# Altium schematic sheet BufferIC_Section.SchDoc
size A4
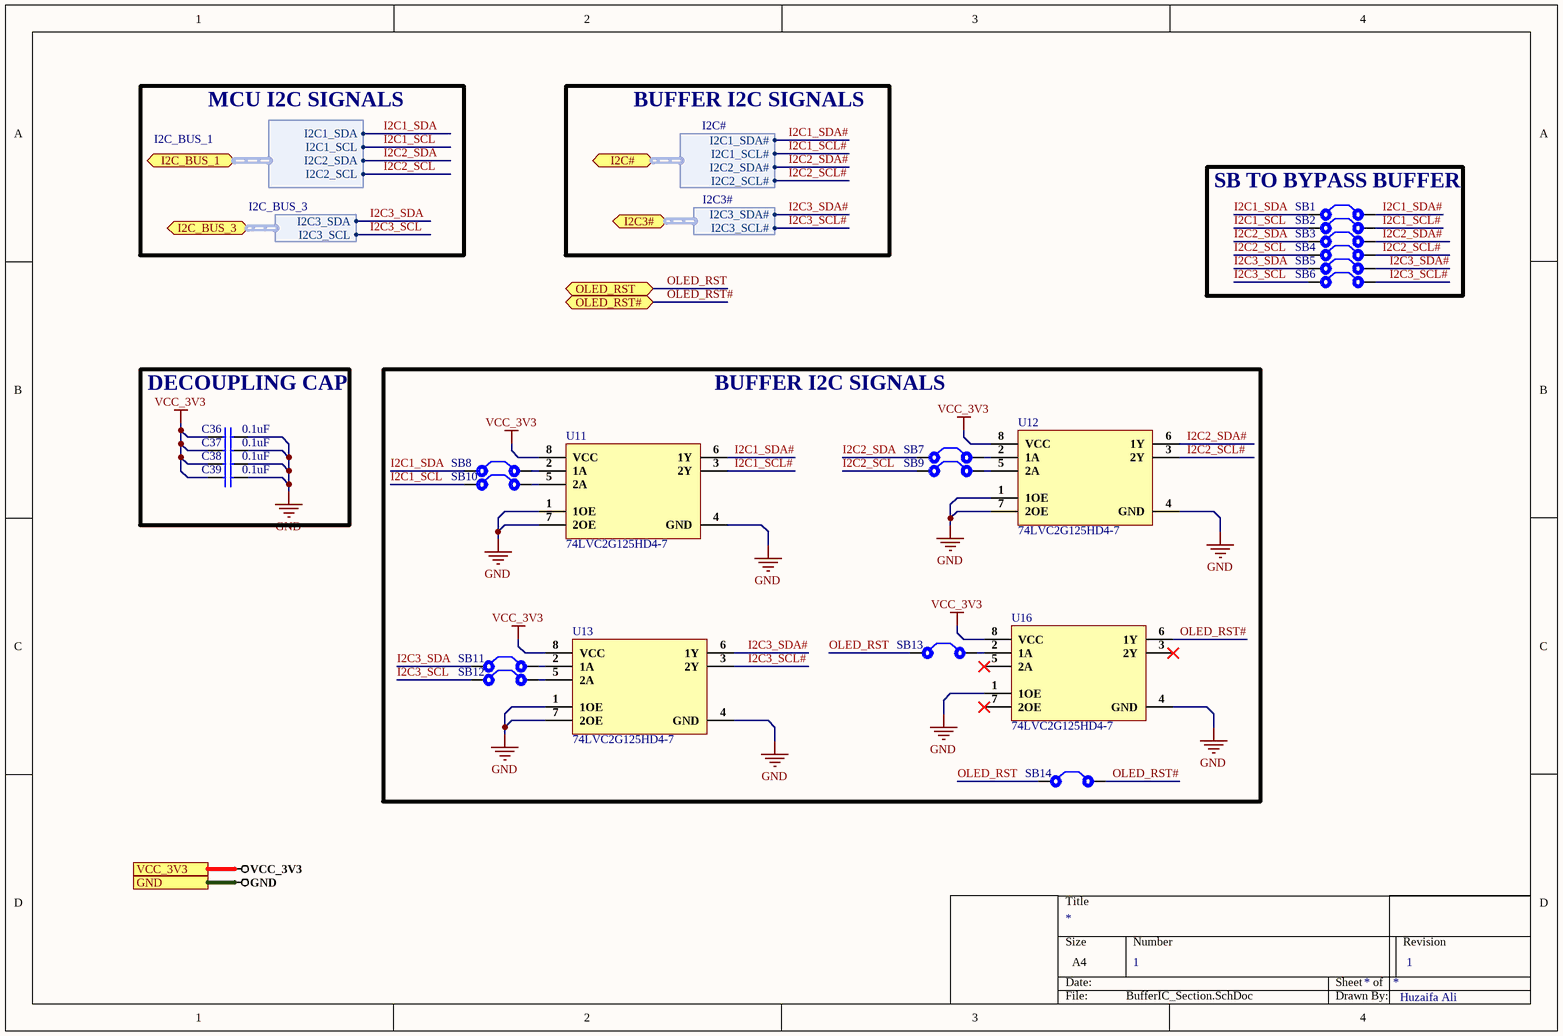
[diagram p0: BufferIC_Section.SchDoc]

## Parts
C36  0.1uF  [Cap0603]
C37  0.1uF  [Cap0603]
C38  0.1uF  [Cap0603]
C39  0.1uF  [Cap0603]
SB1  Solder Bridge  [Solder Bridge]  (value not drawn)
SB2  Solder Bridge  [Solder Bridge]  (value not drawn)
SB3  Solder Bridge  [Solder Bridge]  (value not drawn)
SB4  Solder Bridge  [Solder Bridge]  (value not drawn)
SB5  Solder Bridge  [Solder Bridge]  (value not drawn)
SB6  Solder Bridge  [Solder Bridge]  (value not drawn)
SB7  Solder Bridge  [Solder Bridge]  (value not drawn)
SB8  Solder Bridge  [Solder Bridge]  (value not drawn)
SB9  Solder Bridge  [Solder Bridge]  (value not drawn)
SB10  Solder Bridge  [Solder Bridge]  (value not drawn)
SB11  Solder Bridge  [Solder Bridge]  (value not drawn)
SB12  Solder Bridge  [Solder Bridge]  (value not drawn)
SB13  Solder Bridge  [Solder Bridge]  (value not drawn)
SB14  Solder Bridge  [Solder Bridge]  (value not drawn)
U11  74LVC2G125HD4-7  [74LVC2G125HD4-7]
U12  74LVC2G125HD4-7  [74LVC2G125HD4-7]
U13  74LVC2G125HD4-7  [74LVC2G125HD4-7]
U16  74LVC2G125HD4-7  [74LVC2G125HD4-7]

## Blocks framed on the sheet
SB TO BYPASS BUFFER: SB1-SB6
DECOUPLING CAP: C36-C39
BUFFER I2C SIGNALS: SB7-SB14 U11-U13 U16

## Ports
GND, I2C3# (bidir, harness I2C3#), I2C# (bidir, harness I2C#), I2C_BUS_1 (bidir, harness I2C_BUS_1), I2C_BUS_3 (bidir, harness I2C_BUS_3), OLED_RST (bidir), OLED_RST# (bidir), VCC_3V3

## Harnesses
I2C_BUS_1: I2C2_SDA, I2C1_SCL, I2C1_SDA, I2C2_SCL
I2C_BUS_3: I2C3_SDA, I2C3_SCL
I2C#: I2C1_SDA#, I2C1_SCL#, I2C2_SDA#, I2C2_SCL#
I2C3#: I2C3_SDA#, I2C3_SCL#

## Nets
GND: C36.2 C37.2 C38.2 C39.2 U11.1(1OE) U11.4(GND) U11.7(2OE) U12.1(1OE) U12.4(GND) U12.7(2OE) U13.1(1OE) U13.4(GND) U13.7(2OE) U16.1(1OE) U16.4(GND) ; port GND
VCC_3V3: C36.1 C37.1 C38.1 C39.1 U11.8(VCC) U12.8(VCC) U13.8(VCC) U16.8(VCC) ; port VCC_3V3
I2C1_SCL: SB2.1 SB10.1 ; port I2C_BUS_1.I2C1_SCL
I2C1_SCL#: SB2.2 U11.3(2Y) ; port I2C#.I2C1_SCL#
I2C1_SDA: SB1.1 SB8.1 ; port I2C_BUS_1.I2C1_SDA
I2C1_SDA#: SB1.2 U11.6(1Y) ; port I2C#.I2C1_SDA#
I2C2_SCL: SB4.1 SB9.1 ; port I2C_BUS_1.I2C2_SCL
I2C2_SCL#: SB4.2 U12.3(2Y) ; port I2C#.I2C2_SCL#
I2C2_SDA: SB3.1 SB7.1 ; port I2C_BUS_1.I2C2_SDA
I2C2_SDA#: SB3.2 U12.6(1Y) ; port I2C#.I2C2_SDA#
I2C3_SCL: SB6.1 SB12.1 ; port I2C_BUS_3.I2C3_SCL
I2C3_SCL#: SB6.2 U13.3(2Y) ; port I2C3#.I2C3_SCL#
I2C3_SDA: SB5.1 SB11.1 ; port I2C_BUS_3.I2C3_SDA
I2C3_SDA#: SB5.2 U13.6(1Y) ; port I2C3#.I2C3_SDA#
OLED_RST: SB13.1 SB14.1 ; port OLED_RST
OLED_RST#: SB14.2 U16.6(1Y) ; port OLED_RST#
NetSB7_2: SB7.2 U12.2(1A)
NetSB8_2: SB8.2 U11.2(1A)
NetSB9_2: SB9.2 U12.5(2A)
NetSB10_2: SB10.2 U11.5(2A)
NetSB11_2: SB11.2 U13.2(1A)
NetSB12_2: SB12.2 U13.5(2A)
NetSB13_2: SB13.2 U16.2(1A)

Not connected (* = marked no-connect by the designer): U16 3(2Y)* 5(2A)* 7(2OE)*

## Notes on the sheet
- MCU I2C SIGNALS
- BUFFER I2C SIGNALS
- 1
- Huzaifa Ali

## Library data of the parts
C36-C39 = CC0603ZRY5V9BB104: CAP CER 0.1UF 50V Y5V 0603; Manufacturer: Yageo; Capacitance: 100nF; Tolerance: 80%; Supplier 1: Digi-Key; Manufacturer Part Number: CC0603ZRY5V9BB104; Stock 1: 15000880; Pricing 1: 1=0.1, 10=0.075, 100=0.0334, 500=0.02386, 1000=0.01874 (USD); Mount: Surface Mount; Case/Package: 0603; Number of Pins: 2; Case Code (Metric): 1608; Case Code (Imperial): 0603; Min Operating Temperature: -30°C; Max Operating Temperature: 85°C; Dielectric: Y5V; Voltage Rating: 50V; Package Quantity: 1; Packaging: Tape and Reel; Voltage Rating (DC): 50V; Termination: SMD/SMT; Composition: Ceramic; Voltage: 50V; Length: 1.6mm; Height: 0.8mm; Width: 0.031inch; Thickness: 0.035inch; Depth: 0.8mm; Radiation Hardening: No; REACH SVHC: No SVHC; Lead Free: Lead Free; Halogen Free: Halogen Free; ComponentLink1URL: http://www.yageo.com/documents/recent/UPY-GPHC_Y5V_6.3V-to-50V_8.pdf?src-supplier=Digi-Key; ComponentLink1Description: http://www.yageo.com/documents/recent/UPY-GPHC_Y5V_6.3V-to-50V_8.pdf?src-supplier=Digi-Key; ComponentLink2URL: http://www.yageo.com/documents/recent/UPY-GPHC_Y5V_6.3V-to-50V_5.pdf?src-supplier=Avnet+Europe; ComponentLink2Description: http://www.yageo.com/documents/recent/UPY-GPHC_Y5V_6.3V-to-50V_5.pdf?src-supplier=Avnet+Europe; ComponentLink3URL: https://www.verical.com/server-webapp/html/getDatasheet?partID=403611&src-supplier=Verical; ComponentLink3Description: https://www.verical.com/server-webapp/html/getDatasheet?partID=403611&src-supplier=Verical; ComponentLink4URL: http://www.mouser.com/ds/2/447/Yageo_UPY-GP_NP0_16V-to-50V_9-358835.pdf?src-supplier=Mouser; ComponentLink4Description: http://www.mouser.com/ds/2/447/Yageo_UPY-GP_NP0_16V-to-50V_9-358835.pdf?src-supplier=Mouser; ComponentLink5URL: http://www.farnell.com/datasheets/1132289.pdf?src-supplier=Element14; ComponentLink5Description: http://www.farnell.com/datasheets/1132289.pdf?src-supplier=Element14; Supplier Part Number 1: 311-1343-1-ND
SB1-SB14 = Solder Bridge: Solder Bridge ON
U11-U13 U16 = 74LVC2G125HD4-7: IC BUFFER NON-INVERT 5.5V 8DFN; Manufacturer: Diodes; Logic Function: Buffer,Inverting; Number of Elements: 2; Number of Bits per Element: 1; High Level Output Current: 32mA; Supplier 1: Digi-Key; Manufacturer Part Number: 74LVC2G125HD4-7; RoHS: Yes; Category: Logic Gates; Pricing 1: 1=0.47000, 10=0.35300, 25=0.30880, 100=0.19980, 250=0.16536, 500=0.13228, 1000=0.10142, 2500=0.08819 (USD); Mount: Surface Mount; Number of Pins: 8; Min Operating Temperature: -40°C; Max Operating Temperature: 125°C; Packaging: Tape and Reel; Low Level Output Current: 32mA; RoHS Compliant: Yes; ComponentLink1URL: https://www.diodes.com/assets/Datasheets/74LVC2G125.pdf?src-supplier=Digi-Key; ComponentLink1Description: https://www.diodes.com/assets/Datasheets/74LVC2G125.pdf?src-supplier=Digi-Key; Supplier Part Number 1: 74LVC2G125HD4-7DIDKR-ND